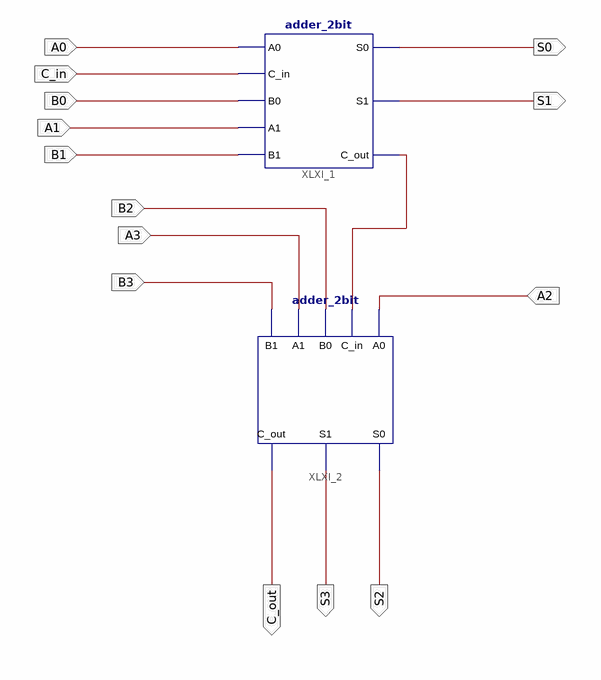
[diagram p0: schematic sheet 1]
// Xilinx ISE schematic adder_4bit.sch (spartan3e) as structural Verilog: 2 symbols, 14 ports
module adder_4bit (
  input  A0,
  input  C_in,
  input  B0,
  input  A1,
  input  B1,
  input  A2,
  input  B2,
  input  A3,
  input  B3,
  output S0,
  output S1,
  output S2,
  output S3,
  output C_out
);

  wire XLXN_8;

  adder_2bit XLXI_1 (.A0(A0), .C_in(C_in), .B0(B0), .A1(A1), .B1(B1), .S0(S0), .S1(S1), .C_out(XLXN_8));
  adder_2bit XLXI_2 (.A0(A2), .C_in(XLXN_8), .B0(B2), .A1(A3), .B1(B3), .S0(S2), .S1(S3), .C_out(C_out));
endmodule
